# Altium schematic sheet Alici_Karti_Blok_Diyagram_V2.SchDoc
size A4; SheetNumber: 3; SheetTotal: 6
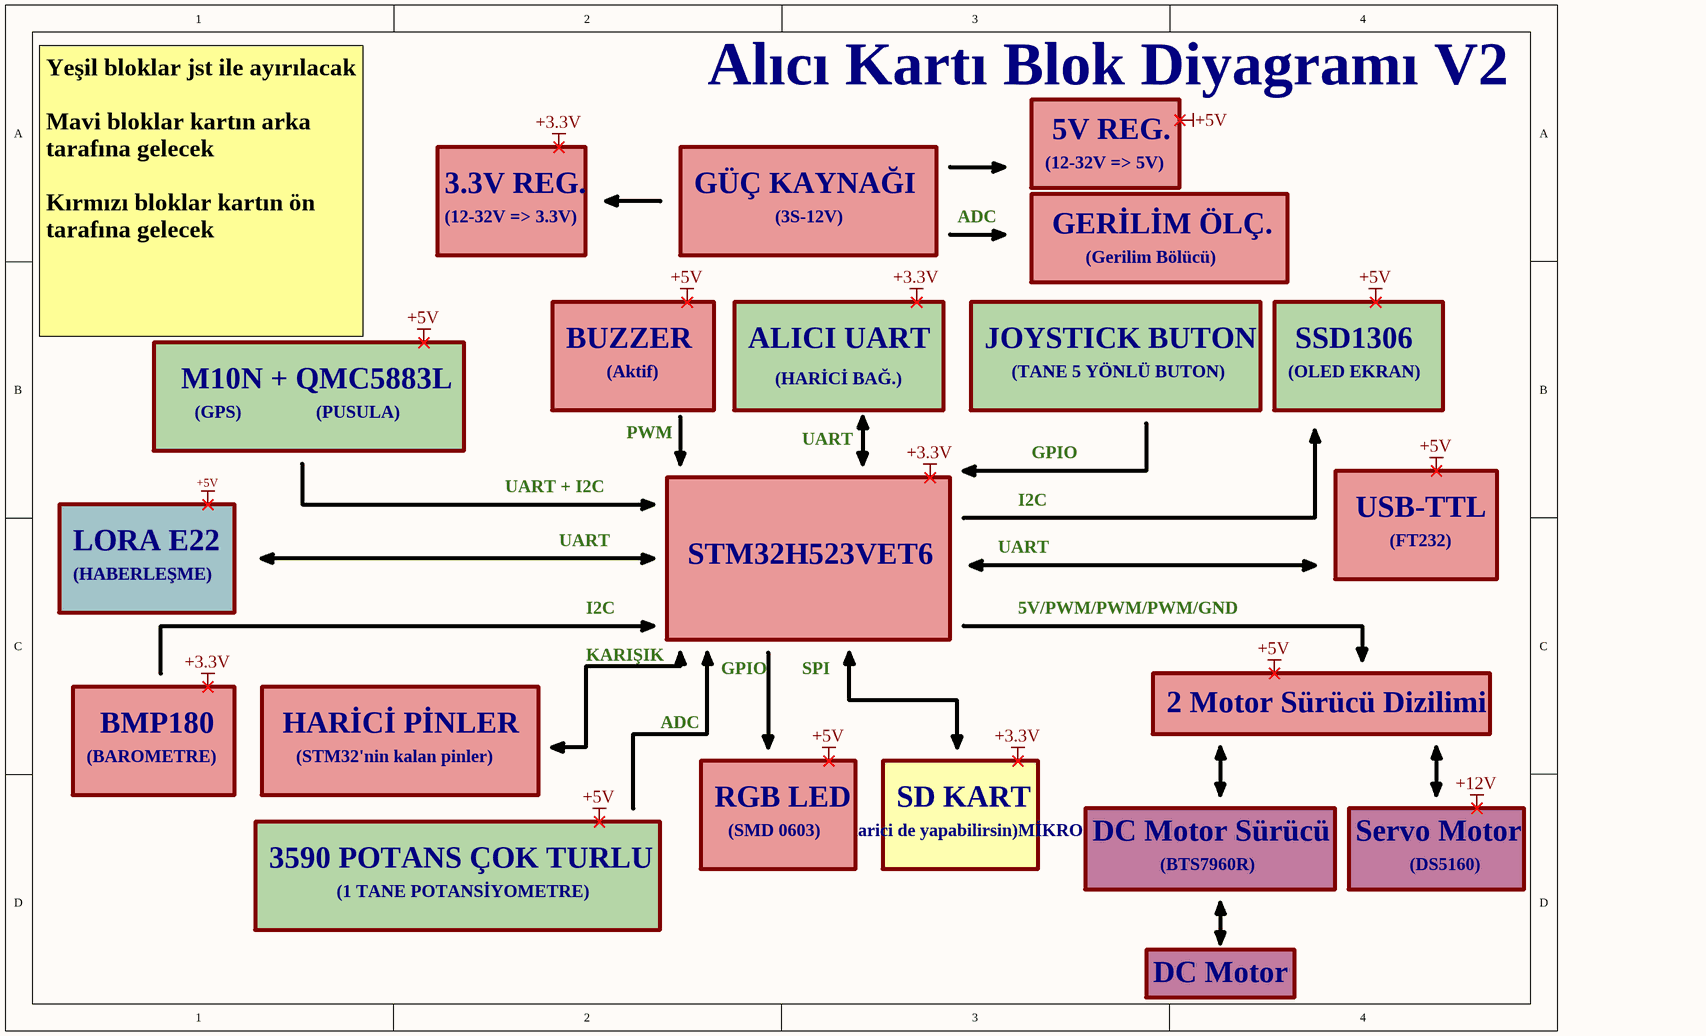
[diagram p0: Alici_Karti_Blok_Diyagram_V2.SchDoc]

## Notes on the sheet
- Alıcı Kartı Blok Diyagramı V2
- (12-32V => 5V)
- 5V REG.
- 3.3V REG.
- (12-32V => 3.3V)
- GÜÇ KAYNAĞI
- (3S-12V)
- ADC
- GERİLİM ÖLÇ.
- (Gerilim Bölücü)
- Yeşil bloklar jst ile ayırılacak
  Mavi bloklar kartın arka tarafına gelecek
  Kırmızı bloklar kartın ön tarafına gelecek
- BUZZER
- (Aktif)
- ALICI UART
- (HARİCİ BAĞ.)
- JOYSTICK BUTON
- (TANE 5 YÖNLÜ BUTON)
- (OLED EKRAN)
- SSD1306
- M10N + QMC5883L
- (GPS)
- (PUSULA)
- PWM
- UART
- UART + I2C
- I2C
- GPIO
- USB-TTL
- LORA E22
- (HABERLEŞME)
- STM32H523VET6
- (FT232)
- 5V/PWM/PWM/PWM/GND
- KARIŞIK
- SPI
- 2 Motor Sürücü Dizilimi
- (BAROMETRE)
- BMP180
- HARİCİ PİNLER
- (STM32'nin kalan pinler)
- RGB LED
- (SMD 0603)
- ((harici de yapabilirsin)MİKRO SD)
- SD KART
- DC Motor Sürücü
- Servo Motor
- 3590 POTANS ÇOK TURLU
- (1 TANE POTANSİYOMETRE)
- (BTS7960R)
- (DS5160)
- DC Motor
- Labels drawn without touching a wire or pin: +3.3V, +5V, +12V